# Altium project Boost.PrjPcb
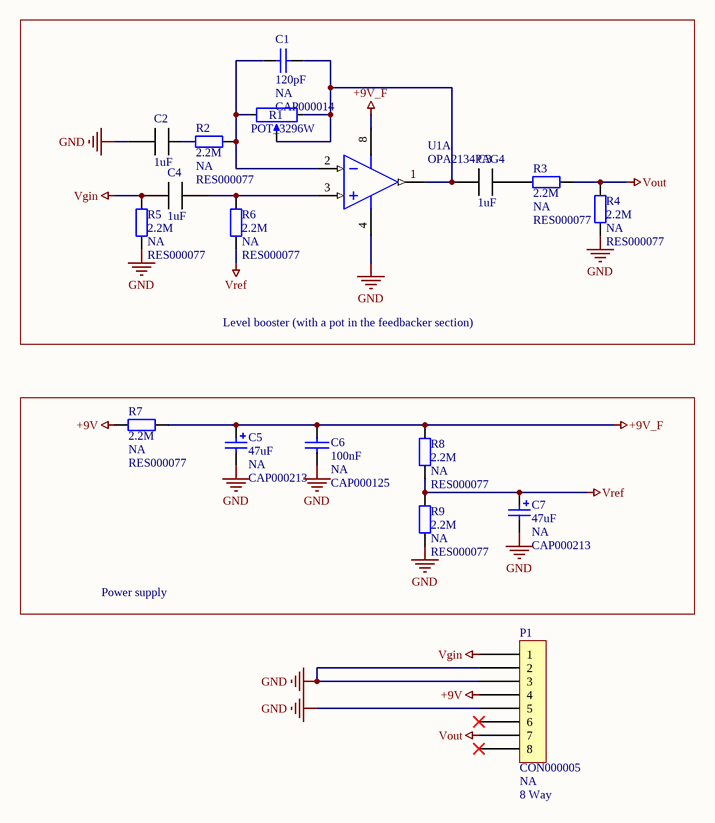
[diagram p0: Boost.SchDoc]
1 sheet, 18 parts. Net scope: global (net labels, ports and power ports of the same name join across sheets).
Board file: Boost.PcbDoc

## Sheet Boost.SchDoc: A3 Template
size A3; Author: Duleepa J Thrimawithana; CompanyName: The University of Auckland; Organization: Department of ECSE; Address1: 20 Symonds Street; Address2: Auckland 101; Address3: New Zealand; Revision: 1R0; SheetNumber: 1; SheetTotal: 1

### Parts
C1  CAP000014  value 120pF  Component Type: NA  [ECE-CAPR0.2x0.1TH]
C2  1uF  [MKS2C041001F00KSSD-Footprint-1]
C3  1uF  [MKS2C041001F00KSSD-Footprint-1]
C4  1uF  [MKS2C041001F00KSSD-Footprint-1]
C5  CAP000213  value 47uF  Component Type: NA  [ECE-CAPPR2-5X11TH]
C6  CAP000125  value 100nF  Component Type: NA  [ECE-CAPR0.2x0.1TH]
C7  CAP000213  value 47uF  Component Type: NA  [ECE-CAPPR2-5X11TH]
P1  CON000005  value 8 Way  Component Type: NA  [ECE-600108STTH]
R1  POT_3296W  [POT_3296W]
R2  RES000077  value 2.2M  Component Type: NA  [ECE-RESA0.4TH]
R3  RES000077  value 2.2M  Component Type: NA  [ECE-RESA0.4TH]
R4  RES000077  value 2.2M  Component Type: NA  [ECE-RESA0.4TH]
R5  RES000077  value 2.2M  Component Type: NA  [ECE-RESA0.4TH]
R6  RES000077  value 2.2M  Component Type: NA  [ECE-RESA0.4TH]
R7  RES000077  value 2.2M  Component Type: NA  [ECE-RESA0.4TH]
R8  RES000077  value 2.2M  Component Type: NA  [ECE-RESA0.4TH]
R9  RES000077  value 2.2M  Component Type: NA  [ECE-RESA0.4TH]
U1  OPA2134PAG4  [TI-P8]  (part A of 2)

### Blocks framed on the sheet
Level booster (with a pot in the feedbacker section): C1-C4 R1-R6 U1
Power supply: C5-C7 R7-R9

### Nets
+9V: P1.4 R7.2
+9V_F: C5.1 C6.1 R7.1 R8.2 U1.8(V+)
GND: C2.1 C5.2 C6.2 C7.2 P1.2 P1.3 P1.5 R4.2 R5.1 R9.1 U1.4(V-)
Vgin: C4.1 P1.1 R5.2
Vout: P1.7 R3.1 R4.1
Vref: C7.1 R6.1 R8.1 R9.2
NetC1_1: C1.1 R1.1 R2.1 U1.2(IN_A-)
NetC1_2: C1.2 C3.1 R1.2 R1.W U1.1(OUT_A)
NetC2_2: C2.2 R2.2
NetC3_2: C3.2 R3.2
NetC4_2: C4.2 R6.2 U1.3(IN_A+)

Not connected (* = marked no-connect by the designer): P1 6* 8*

### Notes on the sheet
- Title:
- Author:
- Date:
- Time:
- Revision:
- Sheet
- of
- File:

### Library data of the parts
C1 = CMP-039-000013-1: CAP CER 120pF 50V TH; Path: ece/ts/Lists/Stock Inventory; Assembly Method: Through hole; Item Type: Item; Status: Obsolete; Category: Capacitor; UoA Stock#: CAP000014; Size/Package: Radial; Voltage/Current: 50V; Datasheet Link: http://share.engineering.auckland.ac.nz/ece/ts/Student%20Documents/CER%20CAP.pdf
C2-C4 = C_FILM_1u_63V_MKS2: Film Cap PET, 1uf 63V, 5mm
C5 C7 = CMP-039-000102-1: CAP ELEC 47uF 25V TH; Manufactuer: Suntan; Assembly Method: Through hole; Item Type: Item; Path: ece/ts/Lists/Stock Inventory; Supplier1: Electus; Status: Active; Supplier1-PN: RE6110; Review-date: 41981; UoA Stock#: CAP000213; Voltage/Current: 25V; Datasheet Link: http://share.engineering.auckland.ac.nz/ece/ts/Student%20Documents/CAP-SuntanTS14.pdf; Category: Capacitor; Size/Package: 5X11
C6 = CMP-039-000079-1: CAP MKT 100nF 100V TH; Manufactuer: Suntan; Path: ece/ts/Lists/Stock Inventory; Item Type: Item; Assembly Method: Through hole; Supplier1: Electus; Category: Capacitor; UoA Stock#: CAP000125; Supplier1-PN: RM7125; Status: Active; Datasheet Link: http://share.engineering.auckland.ac.nz/ece/ts/Student%20Documents/Caps-TS05.pdf; Size/Package: Radial; Voltage/Current: 100V
P1 = CMP-040-000004-1: HEADER POLARISED 8WAY TH; Manufacturer-PN: 600108ST; Manufactuer: GTK; Path: ece/ts/Lists/Stock Inventory; Item Type: Item; Assembly Method: Through hole; Supplier1-PN: YY3N08; Supplier2: Active Components; Supplier2-PN: 600108ST; UoA Stock#: CON000005; Size/Package: 2.54 Radial; Category: Connector; Datasheet Link: http://share.engineering.auckland.ac.nz/ece/ts/Student%20Documents/polarised_connectors.pdf; Supplier1: Elecon; Status: Active
R1 = CMP-00007-2: Generic multi-turn potentiometer 2.54mm pitch mid wiper; Voltage Rating: 250V; Value: *; Package: 0805
R2-R9 = CMP-052-000076-1: RES MF 2M2 TH; Item Type: Item; Assembly Method: Through hole; Path: ece/ts/Lists/Stock Inventory; UoA Stock#: RES000077; Status: Active; Category: Resistor; Size/Package: Axial 10mm
U1 = CMP-0808-00050-1: SoundPlus(TM) High Performance Audio Operational Amplifier, 5 to 36 V, -40 to 125 degC, 8-pin DIP (P8), Green (RoHS & no Sb/Br); Manufacturer: Texas Instruments; GBW(Typ)(MHz): 8; Vmax(V): 36; Number of Channels: 2; Iq per channel(Max)(mA): 5; ComponentLink2URL: http://www.ti.com/general/docs/lit/getliterature.tsp?genericPartNumber=OPA2134&fileType=pdf; ComponentLink3URL: http://www.ti.com/litv/pdf/mpdi001b; DatasheetVersion: SBOS058; PartNumber: OPA2134PAG4; Vmin(V): 5; PackageVersion: 4040082/E, 04/2010; PackageReference: P8; SubFamily: Audio Operational Amplifier; ComponentLink3Description: Package Specification; Code_JEDEC: MS-001; Eco-Plan: Green (RoHS & no Sb/Br); ComponentLink1Description: Manufacturer URL; ComponentLink1URL: http://www.ti.com/; ComponentLink2Description: Datasheet; PackageDescription: 8-Pin Plastic In-Line, Body 9.59 x 6.35 mm, Pitch 2.54 mm; Mounting Technology: Through Hole; Vn at Flatband(Typ)(nV/rtHz): 8